# Altium project PROJECT TB DO NHIP TIM.PrjPcb
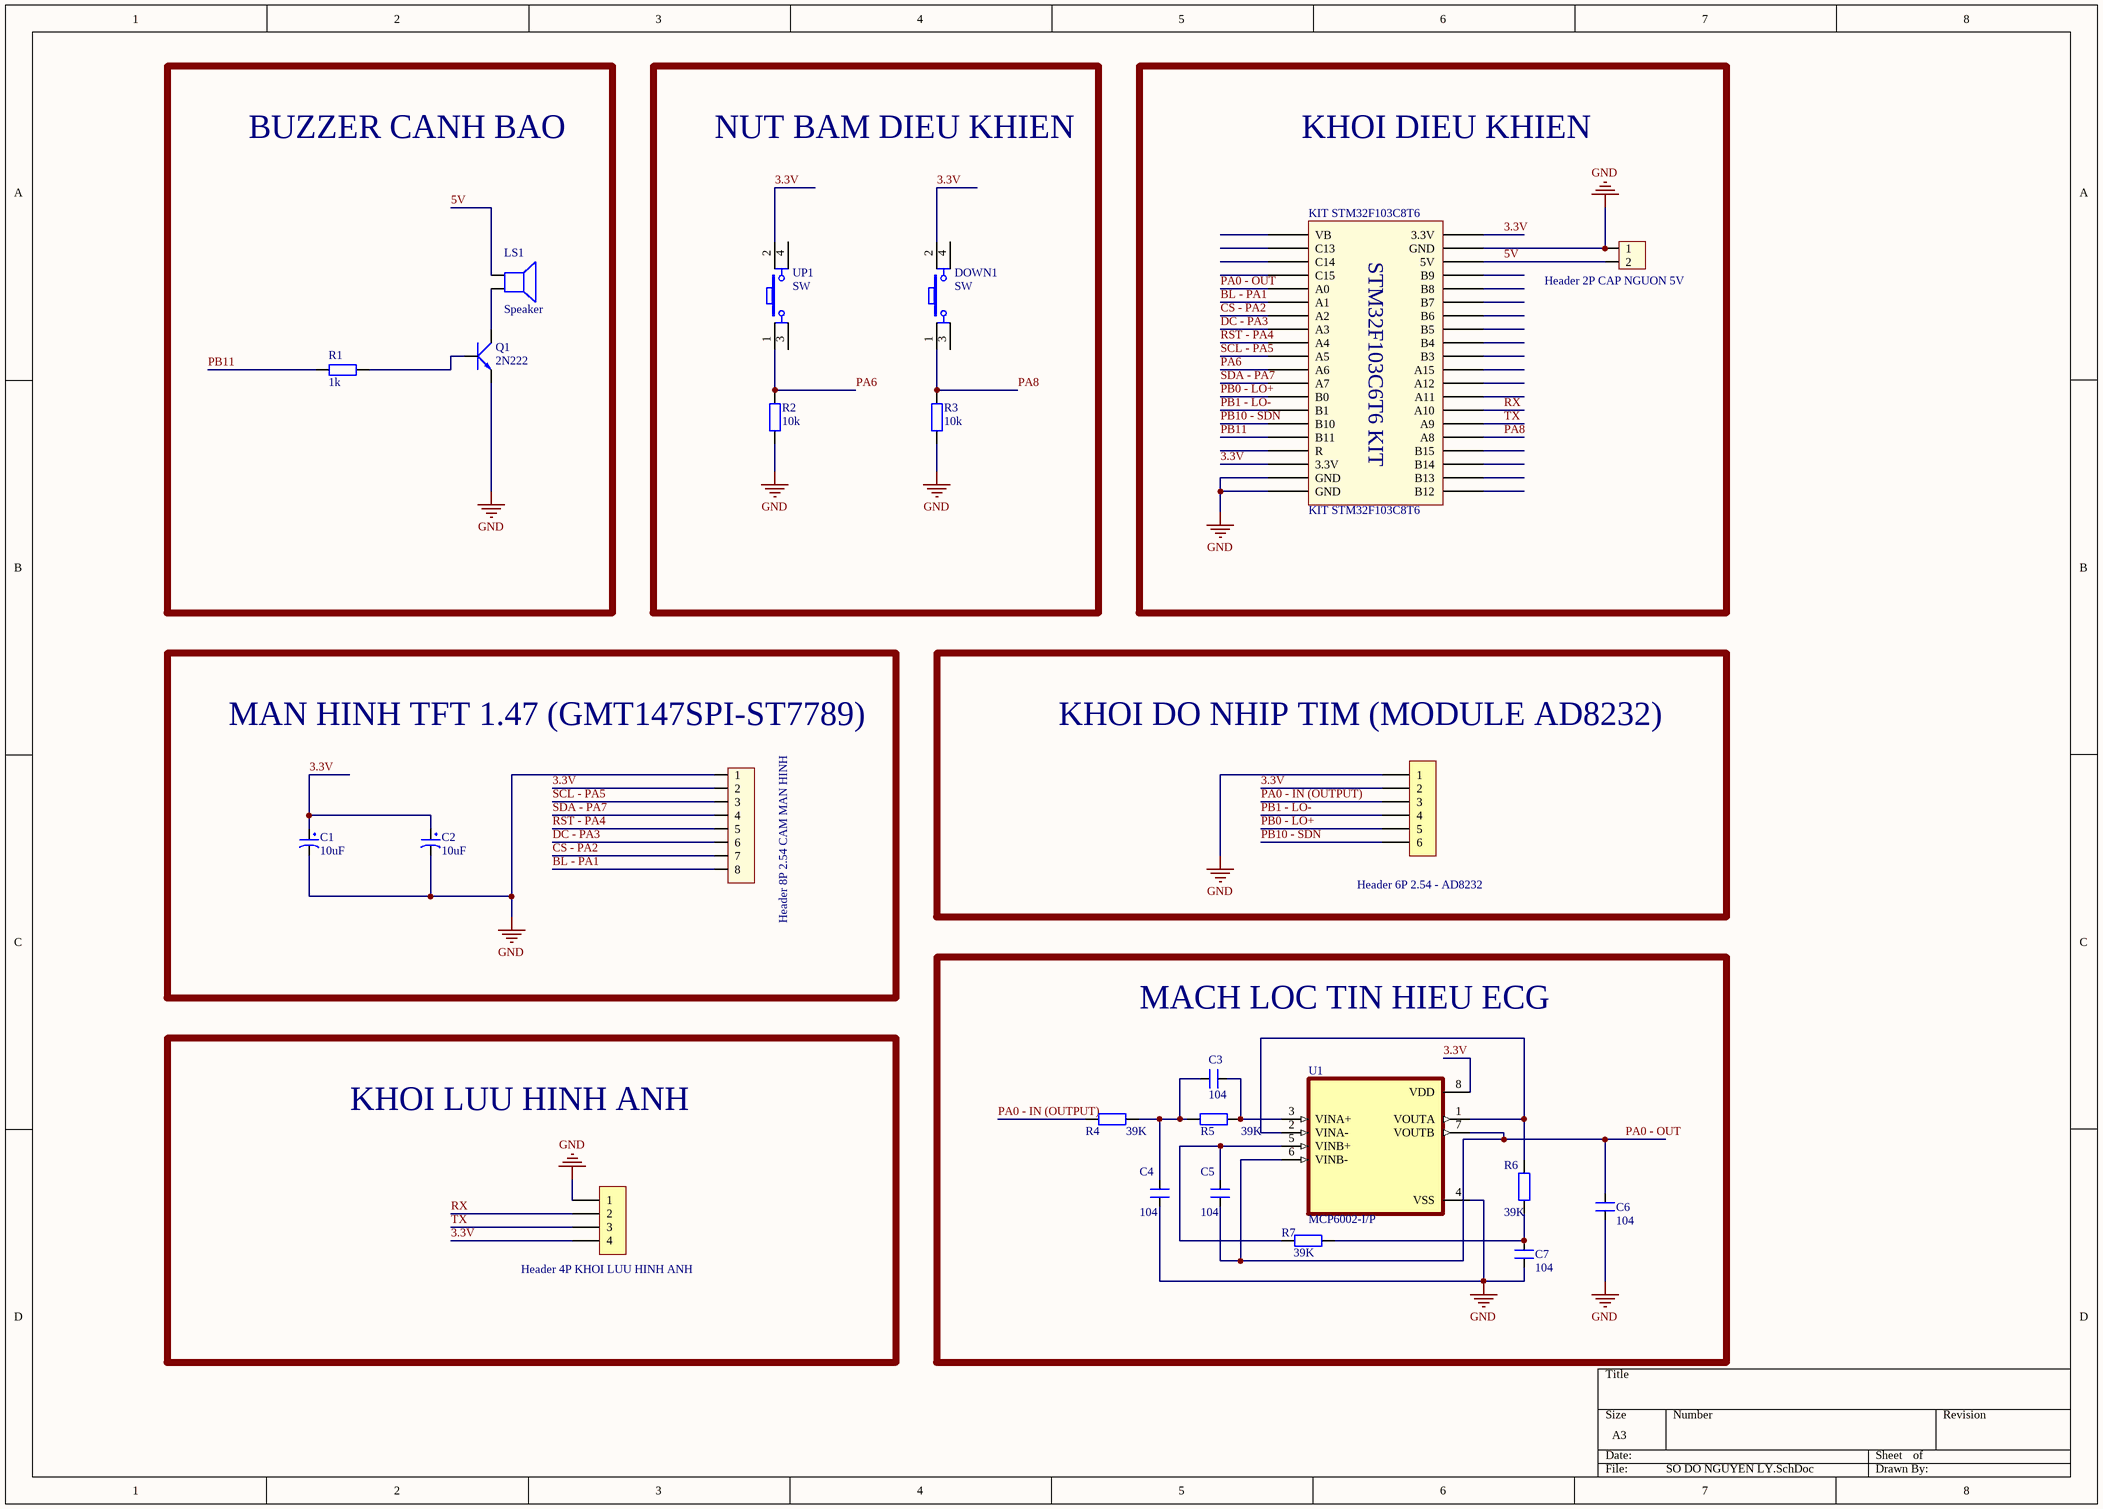
[diagram p0: SO DO NGUYEN LY.SchDoc]
1 sheet, 24 parts. Net scope: global (net labels, ports and power ports of the same name join across sheets).
Board files: PCB3 - DAI= RONG = 65MM.PcbDoc, PCB4.PcbDoc, PCB2.PcbDoc

## Sheet SO DO NGUYEN LY.SchDoc
size A3

### Parts
C1  10uF  [CP1/2]
C2  10uF  [CP1/2]
C3  104  [CN2]
C4  104  [CN2]
C5  104  [CN2]
C6  104  [CN2]
C7  104  [CN2]
DOWN1  SW  [SW4]
H1  Header 2P CAP NGUON 5V  [XH2.54M-2]
H2  Header 6P 2.54 - AD8232  [XH2.54M-6]
H3  Header 8P 2.54 CAM MAN HINH  [XH2.54M-8]
H4  Header 4P KHOI LUU HINH ANH  [XH2.54M-4]
KIT_STM32F103C8T6  KIT STM32F103C8T6  [STM32F103 KIT]
LS1  Speaker  [SPEAKER]
Q1  2N222  [TO92-123]
R1  1k  [R1/4W]
R2  10k  [R1/4W]
R3  10k  [R1/4W]
R4  39K  [R1/4W]
R5  39K  [R1/4W]
R6  39K  [R1/4W]
R7  39K  [R1/4W]
U1  MCP6002-I/P  [DIP787W46P254L927H533Q8]
UP1  SW  [SW4]

### Blocks framed on the sheet
BUZZER CANH BAO: LS1 Q1 R1
NUT BAM DIEU KHIEN: DOWN1 R2 R3 UP1
KHOI DIEU KHIEN: H1 KIT_STM32F103C8T6
MAN HINH TFT 1.47 (GMT147SPI-ST7789): C1 C2 H3
KHOI DO NHIP TIM (MODULE AD8232): H2
MACH LOC TIN HIEU ECG: C3-C7 R4-R7 U1
KHOI LUU HINH ANH: H4

### Nets
GND: C1.2 C2.2 C4.2 C6.1 C7.1 H1.1 H2.1 H3.1 H4.1 KIT_STM32F103C8T6.19(GND) KIT_STM32F103C8T6.39(GND) KIT_STM32F103C8T6.40(GND) Q1.1(E) R2.2 R3.1 U1.4(VSS)
3.3V: C1.1 C2.1 DOWN1.2 H2.2 H3.2 H4.4 KIT_STM32F103C8T6.20(3.3V) KIT_STM32F103C8T6.38(3.3V) U1.8(VDD) UP1.2
5V: H1.2 KIT_STM32F103C8T6.18(5V) LS1.1
BL - PA1: H3.8 KIT_STM32F103C8T6.26(A1)
CS - PA2: H3.7 KIT_STM32F103C8T6.27(A2)
DC - PA3: H3.6 KIT_STM32F103C8T6.28(A3)
PA0 - IN (OUTPUT): H2.3 R4.1
PA0 - OUT: C5.1 C6.2 KIT_STM32F103C8T6.25(A0) U1.6(VINB-) U1.7(VOUTB)
PA6: KIT_STM32F103C8T6.31(A6) R2.1 UP1.1
PA8: DOWN1.1 KIT_STM32F103C8T6.5(A8) R3.2
PB0 - LO+: H2.5 KIT_STM32F103C8T6.33(B0)
PB1 - LO-: H2.4 KIT_STM32F103C8T6.34(B1)
PB10 - SDN: H2.6 KIT_STM32F103C8T6.35(B10)
PB11: KIT_STM32F103C8T6.36(B11) R1.1
RST - PA4: H3.5 KIT_STM32F103C8T6.29(A4)
RX: H4.2 KIT_STM32F103C8T6.7(A10)
SCL - PA5: H3.3 KIT_STM32F103C8T6.30(A5)
SDA - PA7: H3.4 KIT_STM32F103C8T6.32(A7)
TX: H4.3 KIT_STM32F103C8T6.6(A9)
NetC3_1: C3.1 C4.1 R4.2 R5.1
NetC3_2: C3.2 R5.2 U1.3(VINA+)
NetC5_2: C5.2 R7.2 U1.5(VINB+)
NetC7_2: C7.2 R6.1 R7.1
NetLS1_2: LS1.2 Q1.3(C)
NetQ1_2: Q1.2(B) R1.2
NetR6_2: R6.2 U1.1(VOUTA) U1.2(VINA-)

Not connected (* = marked no-connect by the designer): DOWN1 3 4; KIT_STM32F103C8T6 1(B12) 2(B13) 3(B14) 4(B15) 8(A11) 9(A12) 10(A15) 11(B3) 12(B4) 13(B5) 14(B6) 15(B7) 16(B8) 17(B9) 21(VB) 22(C13) 23(C14) 24(C15) 37(R); UP1 3 4

### Notes on the sheet
- (in symbol STM32f103 Bluepill) STM32F103C6T6 KIT

### Library data of the parts
C1 C2 = CP1: Cap P  0,1uF < 22uF , 16 - 50V; Value: 10uF/50V; Description 1: 10 => 220uF/6,3V/10V - 10uF => 100uF/16V; Description 2: 0,1uF => 33uF/50V - 10uF => 22uF/63V; Description 3: 0,47uF => 10uF/100V
C3-C7 = CN2: Cap np 104 => 105pF; Value: 0.1uF
DOWN1 UP1 = SW4: Switch button 4 pin; Value: Button chip 4 pin
H1 = Header 2P 2.54 Duc Thang: C?m; Ten_Linh_Kien: Header 2P XH2.54-2P Ð?c Th?ng; Don_Vi: Con; Ma_Hang: MH001283; Chung_Loai: C?m
H2 = Header 6P 2.54 Duc Thang: C?m; Ten_Linh_Kien: Header 6P XH2.54-6P Ð?c Th?ng; Don_Vi: Con; Ma_Hang: MH001972; Chung_Loai: C?m
H3 = Header 8P 2.54 Duc Thang: C?m; Ten_Linh_Kien: Header 8P XH2.54-8P Ð?c Th?ng; Don_Vi: Con; Ma_Hang: MH003366; Chung_Loai: C?m
H4 = Header 4P 2.54 Duc Thang: C?m; Ten_Linh_Kien: Header 4P XH2.54-4P Ð?c Th?ng; Don_Vi: Con; Ma_Hang: MH001285; Chung_Loai: C?m
KIT_STM32F103C8T6 = STM32f103 Bluepill: KIT STM32F103C8T6 Bluepill
LS1 = Speaker: Loudspeaker; Published: 24-Mar-1999; LatestRevisionDate: 17-Jul-2002; LatestRevisionNote: Re-released for DXP Platform.; PackageReference: PIN2; Publisher: Altium Limited
Q1 = 2N222: NPN 600mW, ECB; Value: C1815
R1-R7 = R1/4W: Resistor 1/4W; Value: R1/4W - 1K
U1 = MCP6002-I/P: Microchip ,Dual Op Amp,1MHz CMOS,Rail to Rail,3V,5V,8-Pin PDIP | Microchip Technology Inc. MCP6002-I/P; SnapEDA_Link: https://www.snapeda.com/parts/MCP6002-I/P/Microchip+Technology/view-part/?ref=snap; Package: DIP-8 Microchip; Value: *; MF: Microchip; MP: MCP6002-I/P; Check_prices: https://www.snapeda.com/parts/MCP6002-I/P/Microchip+Technology/view-part/?ref=eda